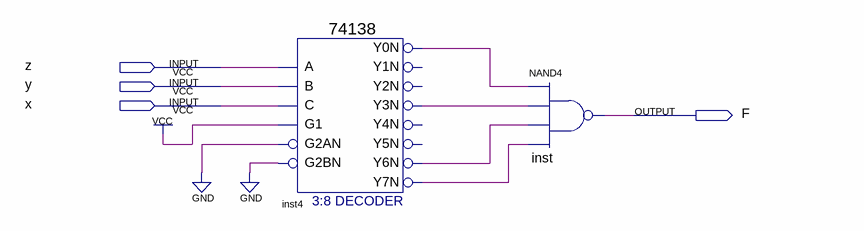
[diagram p0: schematic sheet]
// Quartus schematic design_LAB_5.bdf as structural Verilog: 2 symbols, 4 pins
module design_LAB_5 (
  input  z,
  input  y,
  input  x,
  output F
);

  wire inst4_y0n, inst4_y3n, inst4_y6n, inst4_y7n;

  \74138  inst4 (
    .A(z), .B(y), .G1(1'b1), .C(x), .G2AN(1'b0), .G2BN(1'b0), .Y0N(inst4_y0n), .Y3N(inst4_y3n),
    .Y6N(inst4_y6n), .Y7N(inst4_y7n));  // open: Y1N, Y2N, Y4N, Y5N
  nand inst (F, inst4_y0n, inst4_y3n, inst4_y6n, inst4_y7n);
endmodule
